# Altium schematic sheet RF_LANES.SchDoc: RF
size A3; SheetNumber: 6; SheetTotal: 17
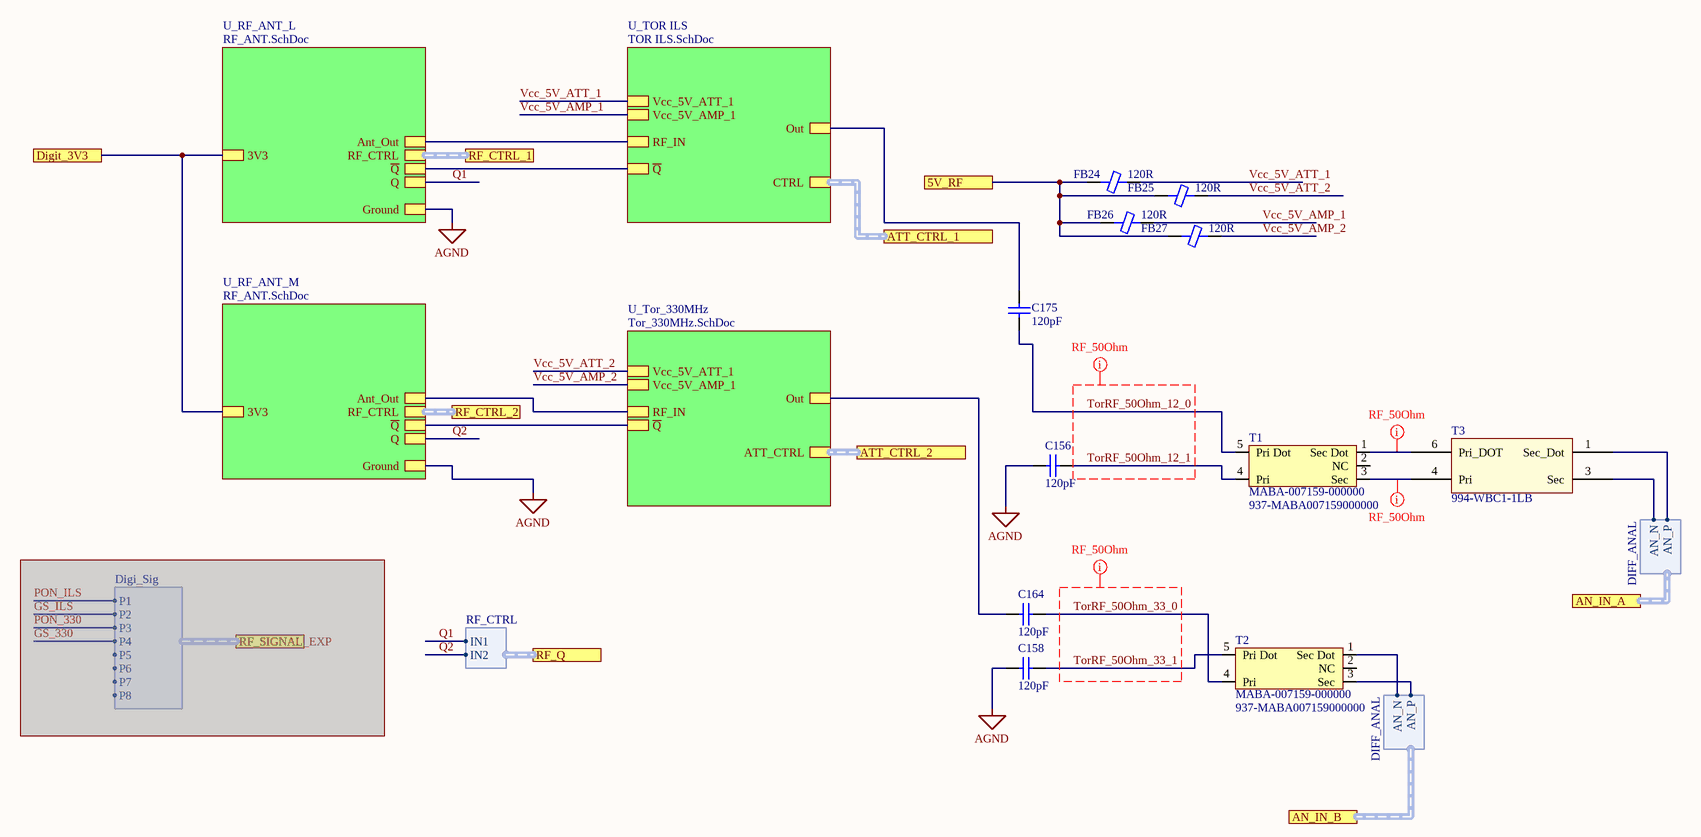
[diagram p0: RF_LANES.SchDoc]

## Parts
C156  120pF  [CAP 0402/1005 RF KK]
C158  120pF  [CAP 0402/1005 RF KK]
C164  120pF  [CAP 0402/1005 RF KK]
C175  120pF  [CAP 0402/1005 RF KK]
FB24  120R  [FER 0402/1005 KK]
FB25  120R  [FER 0402/1005 KK]
FB26  120R  [FER 0402/1005 KK]
FB27  120R  [FER 0402/1005 KK]
T1  MABA-007159-000000  Supplier Part Number 1: 937-MABA007159000000  [MABA-007159-000000]
T2  MABA-007159-000000  Supplier Part Number 1: 937-MABA007159000000  [MABA-007159-000000]
T3  Supplier Part Number 1: 994-WBC1-1LB  [WBC Series SMT Mini Wideband Transformers]  (hidden comment: WBC1-1LB)

## Sub-sheets
U_RF_ANT_L = RF_ANT.SchDoc: Ground, Ant_Out, ~{Q}, RF_CTRL (harness RF_CTRL), 3V3, Q
U_RF_ANT_M = RF_ANT.SchDoc: Ground, Ant_Out, ~{Q}, RF_CTRL (harness RF_CTRL), 3V3, Q
U_TOR ILS = TOR ILS.SchDoc: Vcc_5V_ATT_1, Vcc_5V_AMP_1, RF_IN, Out, CTRL, ~{Q}
U_Tor_330MHz = Tor_330MHz.SchDoc: ATT_CTRL, Vcc_5V_ATT_1, Out, RF_IN, Vcc_5V_AMP_1, ~{Q}

## Ports
5V_RF, AN_IN_A (harness DIFF_ANAL), AN_IN_B (harness DIFF_ANAL), ATT_CTRL_1 (harness ATT_CTRL), ATT_CTRL_2 (harness ATT_CTRL), Digit_3V3, RF_CTRL_1, RF_CTRL_2, RF_Q (harness RF_CTRL), RF_SIGNAL_EXP (harness Digi_Sig)

## Harnesses
Digi_Sig: P1, P2, P3, P4, P5, P6, P7, P8
DIFF_ANAL: AN_P, AN_N
RF_CTRL: IN1, IN2

## Nets
AGND: C156.2 C158.1 ; sheet U_RF_ANT_L/Ground, sheet U_RF_ANT_M/Ground
5V_RF: FB24.1 FB25.1 FB26.1 FB27.1 ; port 5V_RF
Digit_3V3: port Digit_3V3, sheet U_RF_ANT_L/3V3, sheet U_RF_ANT_M/3V3
Q1: sheet U_RF_ANT_L/Q, port RF_Q.IN1
Q2: sheet U_RF_ANT_M/Q, port RF_Q.IN2
TorRF_50Ohm_12_0: C175.1 T1.5(Pri_Dot)
TorRF_50Ohm_12_1: C156.1 T1.4(Pri)
TorRF_50Ohm_33_0: C164.2 T2.4(Pri)
TorRF_50Ohm_33_1: C158.2 T2.5(Pri_Dot)
Vcc_5V_AMP_1: FB26.2 ; sheet U_TOR ILS/Vcc_5V_AMP_1
Vcc_5V_AMP_2: FB27.2 ; sheet U_Tor_330MHz/Vcc_5V_AMP_1
Vcc_5V_ATT_1: FB24.2 ; sheet U_TOR ILS/Vcc_5V_ATT_1
Vcc_5V_ATT_2: FB25.2 ; sheet U_Tor_330MHz/Vcc_5V_ATT_1
NetC164_1: C164.1 ; sheet U_Tor_330MHz/Out
NetC175_2: C175.2 ; sheet U_TOR ILS/Out
NetT1_1: T1.1(Sec_Dot) T3.6(Pri_DOT)
NetT1_3: T1.3(Sec) T3.4(Pri)
NetT2_1: T2.1(Sec_Dot) ; port AN_IN_B.AN_N
NetT2_3: T2.3(Sec) ; port AN_IN_B.AN_P
NetT3_1: T3.1(Sec_Dot) ; port AN_IN_A.AN_P
NetT3_3: T3.3(Sec) ; port AN_IN_A.AN_N
(unnamed): sheet U_TOR ILS/RF_IN, sheet U_RF_ANT_L/Ant_Out
(unnamed): sheet U_TOR ILS/~{Q}, sheet U_RF_ANT_L/~{Q}
(unnamed): sheet U_RF_ANT_M/Ant_Out, sheet U_Tor_330MHz/RF_IN
(unnamed): sheet U_RF_ANT_M/~{Q}, sheet U_Tor_330MHz/~{Q}

Not connected (* = marked no-connect by the designer): T1 2(NC); T2 2(NC)

## Buses and harness runs
harness port ATT_CTRL_1 = sheet U_TOR ILS/CTRL
harness port ATT_CTRL_2 = sheet U_Tor_330MHz/ATT_CTRL
harness port RF_CTRL_1 = sheet U_RF_ANT_L/RF_CTRL
harness port RF_CTRL_2 = sheet U_RF_ANT_M/RF_CTRL

## Layout directives
net class Single50: NetT1_1, NetT1_3, TorRF_50Ohm_12_0, TorRF_50Ohm_12_1, TorRF_50Ohm_33_0, TorRF_50Ohm_33_1

## Notes on the sheet
- Title
- Size:
- Date:
- A3
- Number:
- Time:
- Revision:
- Sheet
- of
- File:

## Library data of the parts
C156 C158 C164 C175 = Capacitor: CAP CER 120PF 25V C0G/NP0 0402; Manufacturer: KEMET; Manufacturer Part Number: C0402C121J3GAC7867; Tolerance: 5%; Supplier 1: Digi-Key; Supplier Part Number 1: 399-14880-1-ND; RoHS: No; Category: Ceramic Capacitors; Stock 1: 43311; Pricing 1: 1=0,10000, 10=0,04100, 50=0,02260, 100=0,01840, 500=0,01312, 1000=0,01032, 2500=0,00938, 5000=0,00863 (USD); Mount: Surface Mount; Case/Package: 0402; Case Code (Imperial): 0402; Case Code (Metric): 1005; Min Operating Temperature: -55°C; Max Operating Temperature: 125°C; Packaging: Tape and Reel; Capacitance: 120pF; Voltage Rating: 25V; ComponentLink1URL: https://api.kemet.com/component-edge/download/datasheet/C0402C121J3GAC7867.pdf?src-supplier=Digi-Key; ComponentLink1Description: https://api.kemet.com/component-edge/download/datasheet/C0402C121J3GAC7867.pdf?src-supplier=Digi-Key
FB24-FB27 = Ferrite: FERRITE BEAD 120 OHM 0402 1LN; Manufacturer: Murata; Manufacturer Part Number: BLM15BB121SN1D; Material: Ferrite,Steel; Tolerance: 25%; Current Rating: 300mA; DC Resistance (DCR): 550mR; Test Frequency: 100MHz; Shielding: Unshielded; Number of Lines: 1; Supplier 1: Digi-Key; Supplier Part Number 1: 490-1008-1-ND; RoHS: Yes; Category: Inductors; Stock 1: 72662; Pricing 1: 1=0,10000, 10=0,08300, 25=0,07440, 50=0,05440, 100=0,04700, 250=0,03712, 500=0,03136, 1000=0,02640, 5000=0,02351 (USD); Case/Package: 0402; Number of Pins: 2; Case Code (Metric): 1005; Case Code (Imperial): 0402; Core Material: Ferrite; Min Operating Temperature: -55°C; Max Operating Temperature: 125°C; Package Quantity: 1; Packaging: Tape and Reel; Max DC Current: 300mA; Termination: SMD/SMT; Frequency: 100MHz; Resistor Type: Ferrite Bead; Impedance: 120R; Max Current Rating: 300mA; Number of Circuits: 1; Length: 1mm; Height: 0.5mm; Width: 0.5mm; Depth: 0.5mm; Lead Free: Lead Free; REACH SVHC: No SVHC; ComponentLink1URL: https://datasheet.ciiva.com/1466/5145-1466832.pdf?src-supplier=Element14; ComponentLink1Description: https://datasheet.ciiva.com/1466/5145-1466832.pdf?src-supplier=Element14; ComponentLink2URL: https://datasheet.ciiva.com/41449/001172179-da-01-en-drossel-0402-120r-1-0x0-5mm-10000st-41449466.pdf?src-supplier=Conrad; ComponentLink2Description: https://datasheet.ciiva.com/41449/001172179-da-01-en-drossel-0402-120r-1-0x0-5mm-10000st-41449466.pdf?src-supplier=Conrad; ComponentLink3URL: https://datasheet.ciiva.com/1466/5145-1466833.pdf?src-supplier=Element14; ComponentLink3Description: https://datasheet.ciiva.com/1466/5145-1466833.pdf?src-supplier=Element14; ComponentLink4URL: https://datasheet.ciiva.com/3082/l0110s0100blm15b-3082680.pdf?src-supplier=Avnet; ComponentLink4Description: https://datasheet.ciiva.com/3082/l0110s0100blm15b-3082680.pdf?src-supplier=Avnet; ComponentLink5URL: https://datasheet.ciiva.com/16213/l0110s0100blm15b-16213674.pdf?src-supplier=Future+Electronics; ComponentLink5Description: https://datasheet.ciiva.com/16213/l0110s0100blm15b-16213674.pdf?src-supplier=Future+Electronics; ComponentLink6URL: https://datasheet.ciiva.com/1012/l0110s0100blm15b-1012029.pdf?src-supplier=Digi-Key; ComponentLink6Description: https://datasheet.ciiva.com/1012/l0110s0100blm15b-1012029.pdf?src-supplier=Digi-Key; ComponentLink7URL: https://datasheet.ciiva.com/1012/l0110s0100blm15b-1012030.pdf?src-supplier=Digi-Key; ComponentLink7Description: https://datasheet.ciiva.com/1012/l0110s0100blm15b-1012030.pdf?src-supplier=Digi-Key; ComponentLink8URL: https://datasheet.ciiva.com/1012/l0110s0100blm15b-1012031.pdf?src-supplier=Digi-Key; ComponentLink8Description: https://datasheet.ciiva.com/1012/l0110s0100blm15b-1012031.pdf?src-supplier=Digi-Key
T1 T2 = MABA-007159-000000: Manufacturer: TE Connectivity MA-COM; Turns Ratio: 1:1; Power Rating: 250mW; Max DC Current: 30mA; Lead/Base Style: Gull Wing; Supplier 1: Mouser; Manufacturer Part Number: MABA-007159-000000; Stock 1: 6455; Pricing 1: 1 = 1,75000, 10 = 1,41000, 50 = 1,41000, 100 = 1,13000, 1000 = 0,88000, 10000 = 0,68800 (USD); RoHS: Yes; Mount: Surface Mount; Case/Package: SMD/SMT; Number of Pins: 5; Min Operating Temperature: -40°C; Max Operating Temperature: 85°C; Packaging: Tape and Reel; Package Quantity: 2000; Termination: SMD/SMT; Length: 3.81mm; Height: 2.67mm; Width: 3.81mm; Depth: 3.81mm; Radiation Hardening: No; Lead Free: Lead Free; ComponentLink1URL: https://datasheet.ciiva.com/3295/maba-007159-000000-3295941.pdf?src-supplier=Avnet; ComponentLink1Description: https://datasheet.ciiva.com/3295/maba-007159-000000-3295941.pdf?src-supplier=Avnet; ComponentLink2URL: https://datasheet.ciiva.com/4550/maba-007159-000000-13414-4550885.pdf?src-supplier=Mouser; ComponentLink2Description: https://datasheet.ciiva.com/4550/maba-007159-000000-13414-4550885.pdf?src-supplier=Mouser; ComponentLink3URL: https://datasheet.ciiva.com/29655/maba-007159-000000-29655720.pdf?src-supplier=Digi-Key; ComponentLink3Description: https://datasheet.ciiva.com/29655/maba-007159-000000-29655720.pdf?src-supplier=Digi-Key; ComponentLink4URL: https://datasheet.ciiva.com/29655/maba-007159-000000-29655722.pdf?src-supplier=Digi-Key; ComponentLink4Description: https://datasheet.ciiva.com/29655/maba-007159-000000-29655722.pdf?src-supplier=Digi-Key
T3 = WBC1-1LB: Wideband RF transformer, SMT, RoHS; Manufacturer: Coilcraft; Core Material: Ferrite; Current Rating: 250mA; Shielding: Unshielded; Inductance: 10uH; Isolation Voltage: 300V; DC Resistance (DCR): 120mR; Power Rating: 250mW; Supplier 1: Mouser; Manufacturer Part Number: WBC1-1LB; RoHS: Yes; Category: Transformers; Stock 1: 958; Pricing 1: 1=3,70000, 10=3,33000, 50=2,96000, 100=2,59000, 200=2,33000, 500=2,14000, 750=1,99000 (USD); Min Operating Temperature: -40°C; Max Operating Temperature: 85°C; Termination: SMD/SMT; Packaging: Tape and Reel; Package Quantity: 100; Length: 4.45mm; Height: 3.05mm; Width: 4.19mm; REACH SVHC: No SVHC; Lead Free: Contains Lead; ComponentLink1URL: http://www.farnell.com/datasheets/1870445.pdf?src-supplier=Farnell; ComponentLink1Description: http://www.farnell.com/datasheets/1870445.pdf?src-supplier=Farnell; ComponentLink2URL: http://www.mouser.com/ds/2/597/wbc-463492.pdf?src-supplier=Mouser; ComponentLink2Description: http://www.mouser.com/ds/2/597/wbc-463492.pdf?src-supplier=Mouser; ComponentLink3URL: http://www.farnell.com/datasheets/1870445.pdf?src-supplier=Element14; ComponentLink3Description: http://www.farnell.com/datasheets/1870445.pdf?src-supplier=Element14